# Altium schematic sheet Sch_Cyborg greenC_Main.SchDoc
size A2; SheetNumber: 1; SheetTotal: 1
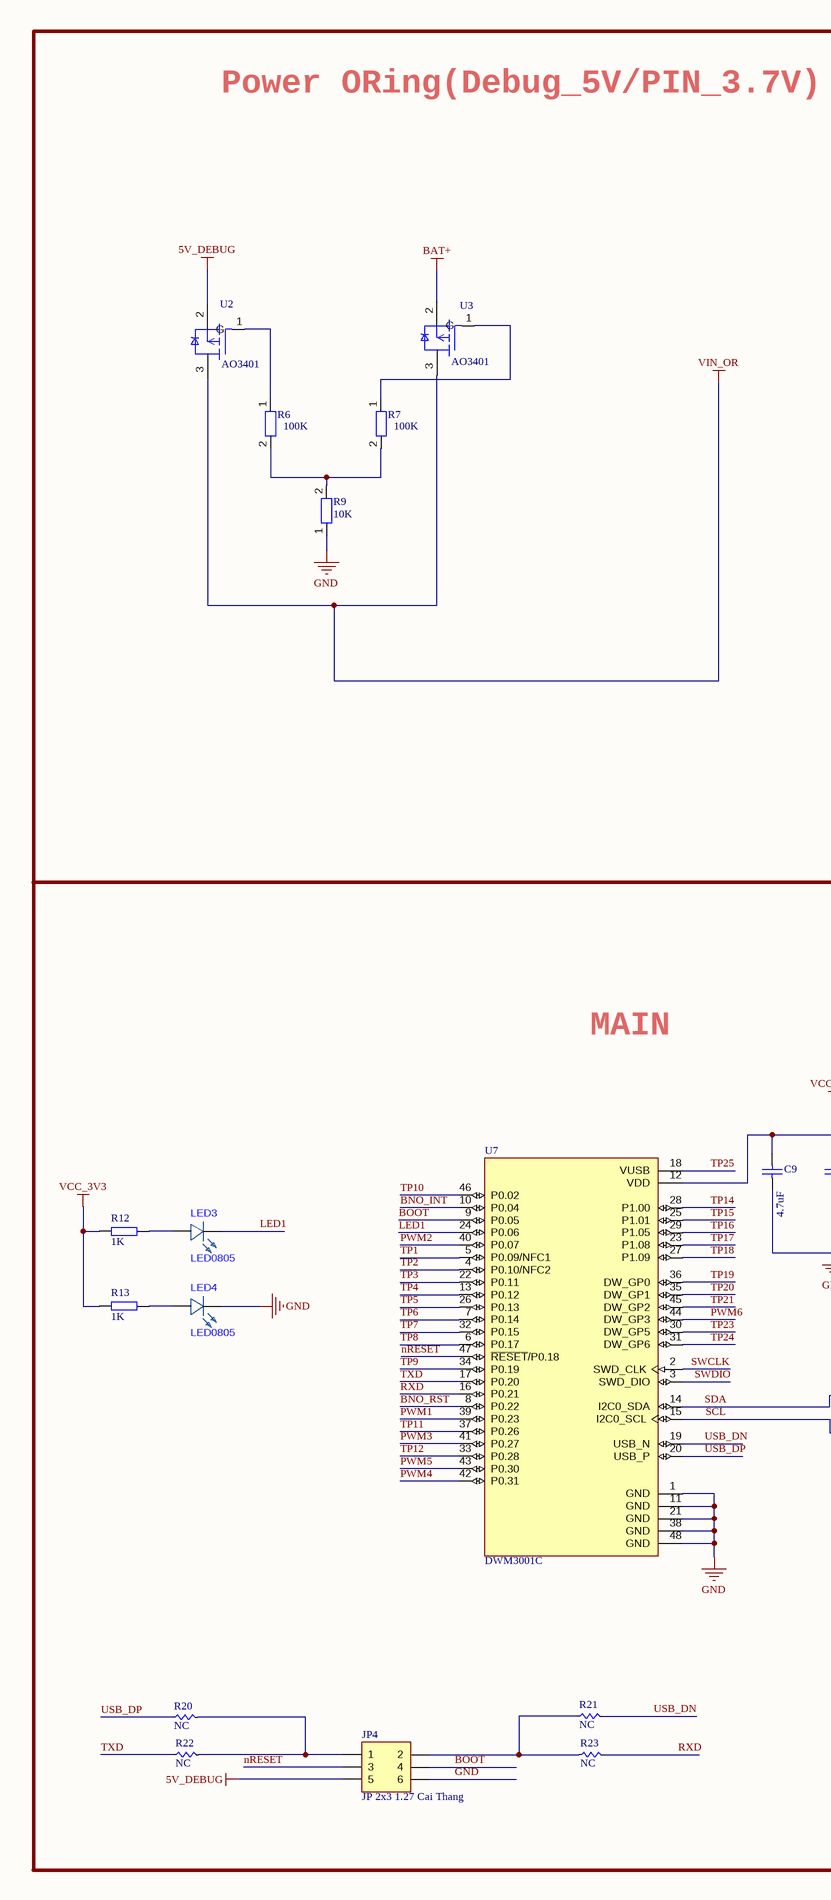
[diagram p0: Sch_Cyborg greenC_Main.SchDoc, left]
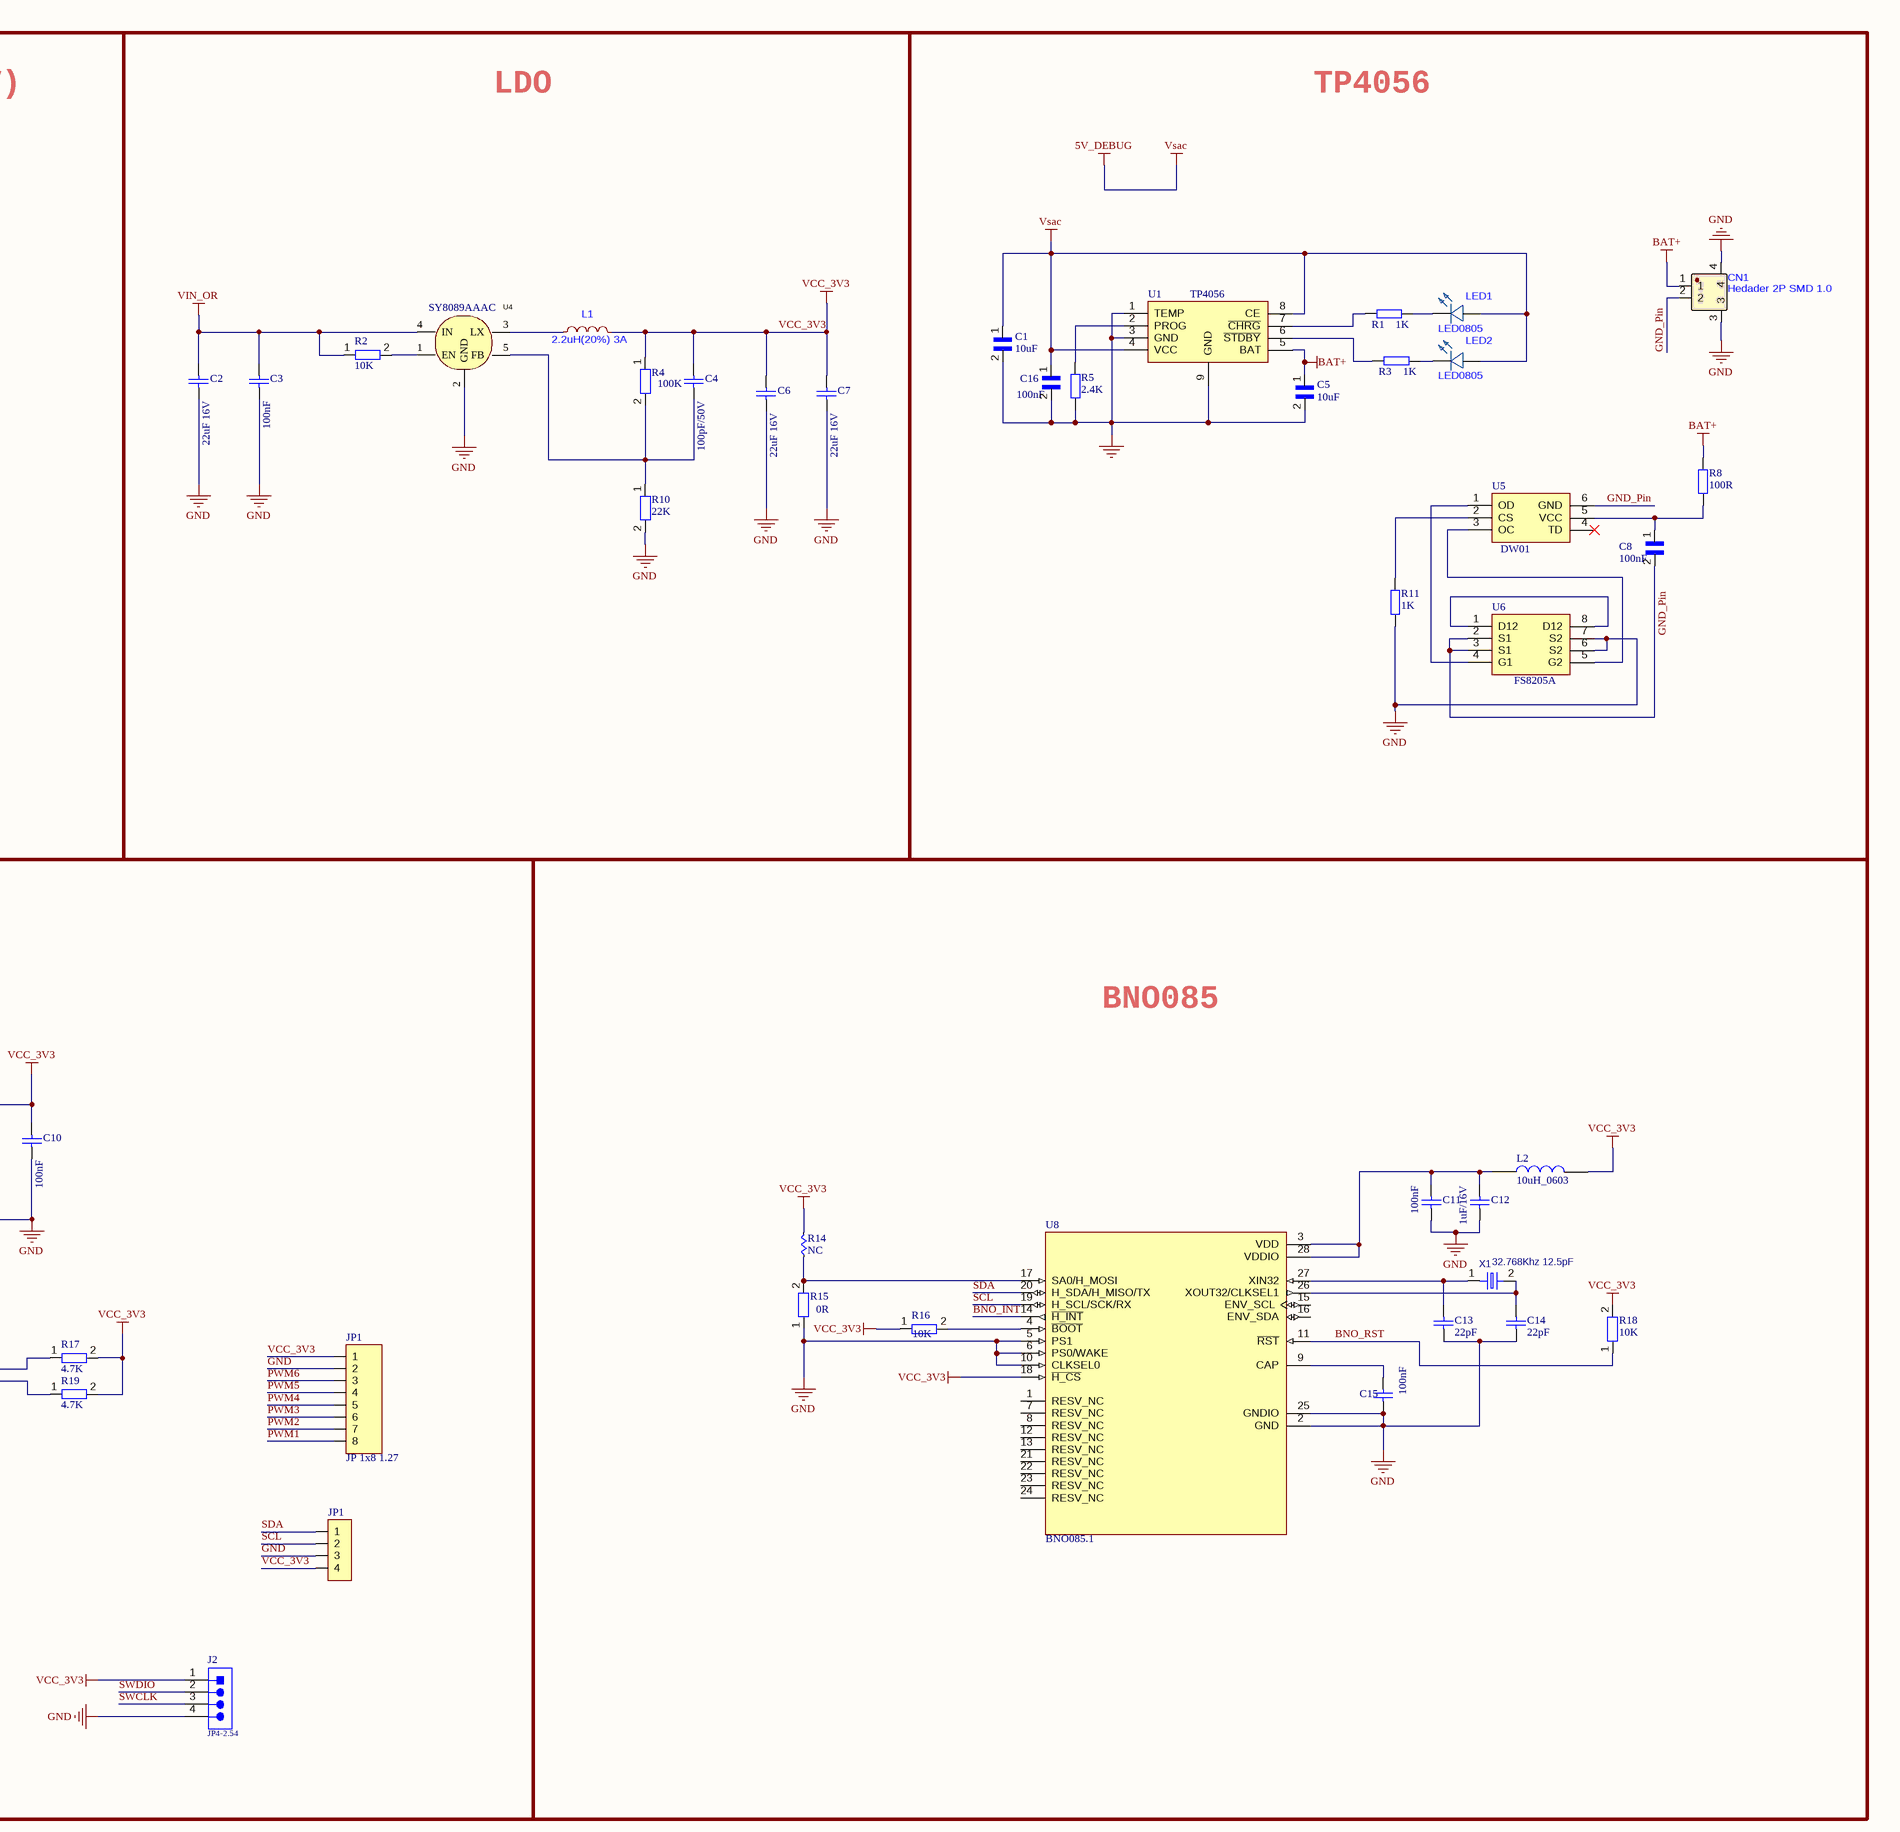
[diagram p1: Sch_Cyborg greenC_Main.SchDoc, right]

## Parts
(Parts that share a designator on the sheet are numbered #1, #2 ... from top to bottom, then left to right.)
C1  10uF  [CAP CERAMIC SMD 0603 TyPE 1608]
C2  22uF 16V  [CAP CERAMIC SMD 0603 TyPE 1608]
C3  100nF  [CAP CERAMIC SMD 0603 TyPE 1608]
C4  100pF/50V  [CAP CERAMIC SMD 0603 TyPE 1608]
C5  10uF  [CAP CERAMIC SMD 0603 TyPE 1608]
C6  22uF 16V  [CAP CERAMIC SMD 0603 TyPE 1608]
C7  22uF 16V  [CAP CERAMIC SMD 0603 TyPE 1608]
C8  100nF  [CAP CERAMIC SMD 0603 TyPE 1608]
C9  4.7uF  [CAP CERAMIC SMD 0603 TyPE 1608]
C10  100nF  [CAP CERAMIC SMD 0603 TyPE 1608]
C11  100nF  [CAP CERAMIC SMD 0603 TyPE 1608]
C12  1uF/16V  [CAP CERAMIC SMD 0603 TyPE 1608]
C13  22pF  [CAP CERAMIC SMD 0603 TyPE 1608]
C14  22pF  [CAP CERAMIC SMD 0603 TyPE 1608]
C15  100nF  [CAP CERAMIC SMD 0603 TyPE 1608]
C16  100nF  [CAP CERAMIC SMD 0603 TyPE 1608]
CN1  Hedader 2P SMD 1.0  [CONN-SMD_2P-P1.00_BX-SH1.0-2PLT]
J2  JP4-2.54  [CONNECTORS MALE HEADERS 1X4 2.54 TYPE STRAIGHT]
JP1#1  JP 1x8 1.27  [HDR-TH_8P-P1.27-V-M]
JP1#2  JP 1x4 1.27  [JP 1x4 CT]  (value not drawn)
JP4  JP 2x3 1.27 Cai Thang  [JP 2X3 CT 1.27]
L1  2.2uH(20%) 3A  [IND-SMD_L3.5-W3.2]
L2  10uH_0603  [L_10uH_0603]
LED1  LED0805  [LED0805-YL]
LED2  LED0805  [LED0805-GR]
LED3  LED0805  [LED0805-BL]
LED4  LED0805  [LED0805-RD]
R1  1K  [RES CHIPS SMD 0603 TYPE 1608]
R2  10K  [Res CHIPS SMD 0603 TYPE 1608]
R3  1K  [Res CHIPS SMD 0603 TYPE 1608]
R4  100K  [Res CHIPS SMD 0603 TYPE 1608]
R5  2.4K  [Res CHIPS SMD 0603 TYPE 1608]
R6  100K  [Res CHIPS SMD 0603 TYPE 1608]
R7  100K  [Res CHIPS SMD 0603 TYPE 1608]
R8  100R  [Res CHIPS SMD 0603 TYPE 1608]
R9  10K  [Res CHIPS SMD 0603 TYPE 1608]
R10  22K  [Res CHIPS SMD 0603 TYPE 1608]
R11  1K  [Res CHIPS SMD 0603 TYPE 1608]
R12  1K  [RES CHIPS SMD 0603 TYPE 1608]
R13  1K  [RES CHIPS SMD 0603 TYPE 1608]
R14  NC  [R0402]
R15  0R  [Res CHIPS SMD 0603 TYPE 1608]
R16  10K  [Res CHIPS SMD 0603 TYPE 1608]
R17  4.7K  [Res CHIPS SMD 0603 TYPE 1608]
R18  10K  [Res CHIPS SMD 0603 TYPE 1608]
R19  4.7K  [Res CHIPS SMD 0603 TYPE 1608]
R20  NC  [R0402]
R21  NC  [R0402]
R22  NC  [R0402]
R23  NC  [R0402]
U1  TP4056  [TP4056]
U2  AO3401  [AO3401]
U3  AO3401  [AO3401]
U4  SY8089AAAC  [SOT-23-5]
U5  DW01  [DW01A]
U6  FS8205A  [FS8205]
U7  DWM3001C  [DWM3001]
U8  BNO085.1  [BNO085]
X1  32.768Khz 12.5pF  [CRYSTALS SMD FC-135 TYPE 2P]

## Blocks framed on the sheet
Power ORing(Debug_5V/PIN_3.7V): R6 R7 R9 U2 U3
LDO: C2-C4 C6 C7 L1 R2 R4 R10 U4
TP4056: C1 C5 C8 C16 CN1 LED1 LED2 R1 R3 R5 R8 R11 U1 U5 U6
MAIN: C9 C10 J2 JP1#1 JP1#2 JP4 LED3 LED4 R12 R13 R17 R19-R23 U7
BNO085: C11-C15 L2 R14-R16 R18 U8 X1

## Nets
5V_DEBUG: C1.1 C16.1 JP4.5 LED1.2(+) LED2.2(+) U1.4(VCC) U1.8(CE) U2.2(S)  [also labelled Vsac]
BAT+: C5.1 CN1.1 R8.2 U1.5(BAT) U3.2(S)
GND: C1.2 C2.2 C3.2 C5.2 C6.2 C7.2 C9.2 C10.2 C11.2 C12.2 C13.1 C14.1 C15.2 C16.2 CN1.3 CN1.4 J2.4 JP1#1.2 JP1#2.3 JP4.6 LED4.1(-) R5.1 R9.1 R10.2 R11.1 R15.1 U1.1(TEMP) U1.3(GND) U1.9(GND) U4.2(GND) U6.6(S2) U6.7(S2) U7.1(GND) U7.11(GND) U7.21(GND) U7.38(GND) U7.48(GND) U8.2(GND) U8.5(PS1) U8.6(PS0/WAKE) U8.10(CLKSEL0) U8.25(GNDIO)
VCC_3V3: C4.1 C6.1 C7.1 C9.1 C10.1 J2.1 JP1#1.1 JP1#2.4 L1.2 L2.2 R4.1 R12.2 R13.2 R14.2 R16.1 R17.2 R18.2 R19.2 U7.12(VDD) U8.18(~{H_CS})
VIN_OR: C2.1 C3.1 R2.1 U2.3(D) U3.3(D) U4.4(IN)
BNO_INT: U7.10(P0.04) U8.14(~{H_INT})
BNO_RST: R18.1 U7.8(P0.22) U8.11(~{RST})
BOOT: JP4.4 U7.9(P0.05)
GND_Pin: C8.2 CN1.2 U5.6(GND) U6.2(S1) U6.3(S1)
LED1: LED3.1(-) U7.24(P0.06)
nRESET: JP4.3 U7.47(~{RESET}/P0.18)
PWM1: JP1#1.8 U7.39(P0.23)
PWM2: JP1#1.7 U7.40(P0.07)
PWM3: JP1#1.6 U7.41(P0.27)
PWM4: JP1#1.5 U7.42(P0.31)
PWM5: JP1#1.4 U7.43(P0.30)
PWM6: JP1#1.3 U7.44(DW_GP3)
RXD: R23.2 U7.16(P0.21)
SCL: JP1#2.2 R19.1 U7.15(I2C0_SCL) U8.19(H_SCL/SCK/RX)
SDA: JP1#2.1 R17.1 U7.14(I2C0_SDA) U8.20(H_SDA/H_MISO/TX)
SWCLK: J2.3 U7.2(SWD_CLK)
SWDIO: J2.2 U7.3(SWD_DIO)
TP1: U7.5(P0.09/NFC1)
TP2: U7.4(P0.10/NFC2)
TP3: U7.22(P0.11)
TP4: U7.13(P0.12)
TP5: U7.26(P0.13)
TP6: U7.7(P0.14)
TP7: U7.32(P0.15)
TP8: U7.6(P0.17)
TP9: U7.34(P0.19)
TP10: U7.46(P0.02)
TP11: U7.37(P0.26)
TP12: U7.33(P0.28)
TP14: U7.28(P1.00)
TP15: U7.25(P1.01)
TP16: U7.29(P1.05)
TP17: U7.23(P1.08)
TP18: U7.27(P1.09)
TP19: U7.36(DW_GP0)
TP20: U7.35(DW_GP1)
TP21: U7.45(DW_GP2)
TP23: U7.30(DW_GP5)
TP24: U7.31(DW_GP6)
TP25: U7.18(VUSB)
TXD: R22.1 U7.17(P0.20)
USB_DN: R21.2 U7.19(USB_N)
USB_DP: R20.1 U7.20(USB_P)
NetC4_2: C4.2 R4.2 R10.1 U4.5(FB)
NetC8_1: C8.1 R8.1 U5.5(VCC)
NetC11_1: C11.1 C12.1 L2.1 U8.3(VDD) U8.28(VDDIO)
NetC13_2: C13.2 U8.27(XIN32) X1.1
NetC14_2: C14.2 U8.26(XOUT32/CLKSEL1) X1.2
NetC15_1: C15.1 U8.9(CAP)
NetJP4_1: JP4.1 R20.2 R22.2
NetJP4_2: JP4.2 R21.1 R23.1
NetL1_1: L1.1 U4.3(LX)
NetLED1_1: LED1.1(-) R1.2
NetLED2_1: LED2.1(-) R3.2
NetLED3_2: LED3.2(+) R12.1
NetLED4_2: LED4.2(+) R13.1
NetR1_1: R1.1 U1.7(~{CHRG})
NetR2_2: R2.2 U4.1(EN)
NetR3_1: R3.1 U1.6(~{STDBY})
NetR5_2: R5.2 U1.2(PROG)
NetR6_1: R6.1 U2.1(G)
NetR6_2: R6.2 R7.2 R9.2
NetR7_1: R7.1 U3.1(G)
NetR11_2: R11.2 U5.2(CS)
NetR14_1: R14.1 R15.2 U8.17(SA0/H_MOSI)
NetR16_2: R16.2 U8.4(~{BOOT})
NetU5_1: U5.1(OD) U6.4(G1)
NetU5_3: U5.3(OC) U6.5(G2)
NetU6_1: U6.1(D12) U6.8(D12)

Not connected (* = marked no-connect by the designer): U5 4(TD)*; U8 1(RESV_NC) 7(RESV_NC) 8(RESV_NC) 12(RESV_NC) 13(RESV_NC) 15(ENV_SCL) 16(ENV_SDA) 21(RESV_NC) 22(RESV_NC) 23(RESV_NC) 24(RESV_NC)

## Notes on the sheet
- DWG NO:
- REV:
- THIS DOCUMENT AND THE DATA DISCLOSED HEREIN OR
- HEREWITH IS THE PROPERTY OF ALTIUM LIMITED AND MAY
- BE FREELY DISTRIBUTED IN WHOLE. NO RIGHTS ARE
- RESERVED OR EXPRESS OR IMPLIED WARANTEE GIVEN.
- REVISION
- DESCRIPTION
- DATE
- APPROVED
- ENG:
- APPROVALS
- PROJECT
- DSN:
- CHK:
- REFERENCE DOCUMENTS
- PROJECT REVISION:
- TITLE
- DOCUMENT REVISION:
- DESIGN ITEM:
- BOM:
- FAB DWG:
- PCB DWG:
- ASSY DWG:
- SCALE:
- A2
- SIZE
- CAGE CODE
- FILE NAME
- DWG NO.
- SHEET
- OF
- REV

## Library data of the parts
C1 C5 C8 C16 = CAP 10uF: 10V 10uF X5R ±10% 0603 Multilayer Ceramic Capacitors MLCC - SMD/SMT ROHS; Manufacturer: Samsung Electro-Mechanics; Manufacturer Part: CL10A106KP8NNNC; Symbol: GMI4013S-2C42DB; Convert to PCB: yes; Origin Footprint: MIC-SMD_BD4.0_B4013AM423-008; Device: GMI4013S-2C42DB; Supplier: LCSC; Supplier Part: C19702; JLCPCB Part Class: Extended Part; Add into BOM: yes
C2-C4 C6 C7 C9-C15 = CAP 0603 50V 10%: 0603 Multilayer Ceramic Capacitors MLCC - SMD/SMT ROHS
J2 = CONNECTORS MALE HEADERS 1X4 2.54: WR-PHD Pin Header, THT, pitch 2.54mm, Single Row, Angled, 4p; Manufacturer Part Number: 61300411021; Manufacturer: Wurth Elektronik; Pin Number: 4; Rated Current: 3A; Working Voltage: 250VAC; Withstanding Voltage: 500VAC; Contact Resistance: 20mOhm; ComponentLink1Description: Manufacturer; ComponentLink1URL: http://www.we-online.de; ComponentLink2Description: Datasheet; ComponentLink2URL: https://www.we-online.com/catalog/datasheet/61300411021.pdf; Pitch: 2.54mm; Operating Temperature: -40 to +105degC; Mounting Technology: THT; Packaging: Bag; Gender: Pin Header; Row Number: Single; Orientation: Angled
JP1#1 = JP 1x8 2.54 Duc Thang: Cắm; Ten_Linh_Kien: Jump Đơn Đực 2.54MM 1x40P Thẳng 11MM; Don_Vi: Con; Ma_Hang: MH000903; Ghi_Chu: *; Kieu_Chan: *; Chung_Loai: Cắm
JP1#2 = JP 1x4 2.54 Cai Thang: Cắm; Ten_Linh_Kien: Jump Đơn Cái 2.54MM 1x20P Thẳng; Don_Vi: Con; Ma_Hang: MH004006; Ghi_Chu: *; Kieu_Chan: *; Chung_Loai: Cắm
L1 = CUON CAM SMD
L2 = L_10uH_0603: Inductor with Inductance 10uH Tol.+/-20% Package 0603 (1608); MF: Murata Electronics; MP: LQM18DN100M70L; SnapEDA_Link: https://www.snapeda.com/parts/LQM18DN100M70L/Murata/view-part/?ref=snap; Package: 0603 Murata; Value: *; Check_prices: https://www.snapeda.com/parts/LQM18DN100M70L/Murata/view-part/?ref=eda
R1 R8 R12 R13 = RES 1K: 62.5mW Thick Film Resistors 50V ±100ppm/℃ ±1% 1kΩ 0402 Chip Resistor - Surface Mount ROHS; Manufacturer: UNI-ROYAL(Uniroyal Elec); Manufacturer Part: 0402WGF1001TCE; Symbol: GMI4013S-2C42DB; Convert to PCB: yes; Origin Footprint: MIC-SMD_BD4.0_B4013AM423-008; Device: GMI4013S-2C42DB; Supplier: LCSC; Supplier Part: C11702; JLCPCB Part Class: Extended Part; Add into BOM: yes
R2 R4 R6 R7 R9 R10 R15-R19 = RES 0603 1%_: ±1% - Chip Resistor - Surface Mount ROHS; Chung_Loai: Dán; Don_Vi: Con; So_Chan: 2; Ma_Hang: MH005880; Kieu_Chan: *
R3 R11 = RES 10K: 62.5mW Thick Film Resistors 50V ±100ppm/℃ ±1% 10kΩ 0402 Chip Resistor - Surface Mount ROHS; Manufacturer: UNI-ROYAL(Uniroyal Elec); Manufacturer Part: 0402WGF1002TCE; Symbol: GMI4013S-2C42DB; Convert to PCB: yes; Origin Footprint: MIC-SMD_BD4.0_B4013AM423-008; Device: GMI4013S-2C42DB; Supplier: LCSC; Supplier Part: C25744; JLCPCB Part Class: Extended Part; Add into BOM: yes
R5 = RES 1.2K: 62.5mW Thick Film Resistors 50V ±100ppm/℃ ±1% 1.2kΩ 0402 Chip Resistor - Surface Mount ROHS; Manufacturer: YAGEO; Manufacturer Part: RC0402FR-071K2L; Symbol: GMI4013S-2C42DB; Convert to PCB: yes; Origin Footprint: MIC-SMD_BD4.0_B4013AM423-008; Device: GMI4013S-2C42DB; Supplier: LCSC; Supplier Part: C138040; JLCPCB Part Class: Extended Part; Add into BOM: yes
R14 R20-R23 = RES 0402: RES SMD 0402; Manufacturer: Vishay Dale; Manufacturer Part Number: CRCW040210K0FKED; Resistance (Ohms): 10k; Tolerance: ±1%; Power (Watts): 0.063W, 1/16W; Temperature Coefficient: ±100ppm/°C; Supplier 1: Digi-Key; RoHS: RoHS Compliant; Category: Resistors; Stock 1: 2392462; Pricing 1: 10=0.083, 50=0.0444, 200=0.0255, 1000=0.0174 (USD); Packaging: Cut Tape (CT); Composition: Thick Film; Features: Automotive AEC-Q200; Operating Temperature: -55°C ~ 155°C; Package / Case: 0402 (1005 Metric); Supplier Device Package: 0402 (1005 Metric); Size / Dimension: 0.039" L x 0.020" W (1.00mm x 0.50mm); Height: 0.016" (0.40mm); Number of Terminations: 2; ComponentLink1URL: http://www.vishay.com/docs/20035/dcrcwe3.pdf; ComponentLink1Description: http://www.vishay.com/docs/20035/dcrcwe3.pdf; Supplier Part Number 1: 541-10.0KLCT-ND
U1 = TP4056: ESOP-8 Battery Management ROHS; Manufacturer: TOPPOWER(Nanjing Extension Microelectronics); Manufacturer Part: TP4056-42-ESOP8; Symbol: GMI4013S-2C42DB; Convert to PCB: yes; Origin Footprint: MIC-SMD_BD4.0_B4013AM423-008; Device: GMI4013S-2C42DB; Supplier: LCSC; Supplier Part: C16581; JLCPCB Part Class: Extended Part; Add into BOM: yes
U2 U3 = AO3401: P-Channel 30 V 4A (Ta) 1.4W (Ta) Surface Mount SOT-23-3; MF: Alpha & Omega Semiconductor; SnapEDA_Link: https://www.snapeda.com/parts/AO3401/Alpha/view-part/?ref=snap; Package: SOT-23-3 Alpha &amp; Omega Semiconductor; Value: *; MP: AO3401; Check_prices: https://www.snapeda.com/parts/AO3401/Alpha/view-part/?ref=eda
U4 = POWER CONVERTERS SY8089AAAC: Manufacturer: silergy(矽力杰); Add into BOM: yes; Function: Step-down type; Switch tube (built-in/external): 内置; Symbol: SY8089AAAC; Device: SY8089AAAC; LCSC Part Name: SY8089AAAC; Supplier Part: C78988; Manufacturer Part: SY8089AAAC; Supplier Footprint: SOT-23-5; JLCPCB Part Class: Extended Part; Datasheet: https://atta.szlcsc.com/upload/public/pdf/source/20210826/394049C81A2AF57A190C26FDBC282657.pdf; Supplier: LCSC; Convert to PCB: yes; Input Voltage: -; Output Current (Max): -; Switching Frequency: -; Synchronous Rectification: -; Number of Outputs: -; Topology: -
U6 = FS8205
U7 = DWM3001C: RF Modules 6.5 & 8.0 GHz Ultra-Wideband (UWB) Module with BLE SoC and Motion Sensor; MF: Qorvo; SnapEDA_Link: https://www.snapeda.com/parts/DWM3001C/Qorvo/view-part/?ref=snap; Package: None; Value: *; MP: DWM3001C; Check_prices: https://www.snapeda.com/parts/DWM3001C/Qorvo/view-part/?ref=eda
X1 = CRYSTALS 2P: Crystals ROHS; BOM_Manufacturer: TAITIEN(泰艺电子); BOM_Manufacturer Part: XIHCELNANF-12MHZ; nameAlias: Frequency; Contributor: LCSC; BOM_Supplier: LCSC; BOM_Supplier Part: C295072; BOM_JLCPCB Part Class: Extended Part; spicePre: X; spiceSymbolName: XIHCELNANF-12MHZ